# Altium schematic sheet VSR-05-2-2.1.SchDoc
size A4; SheetNumber: 2; SheetTotal: 2
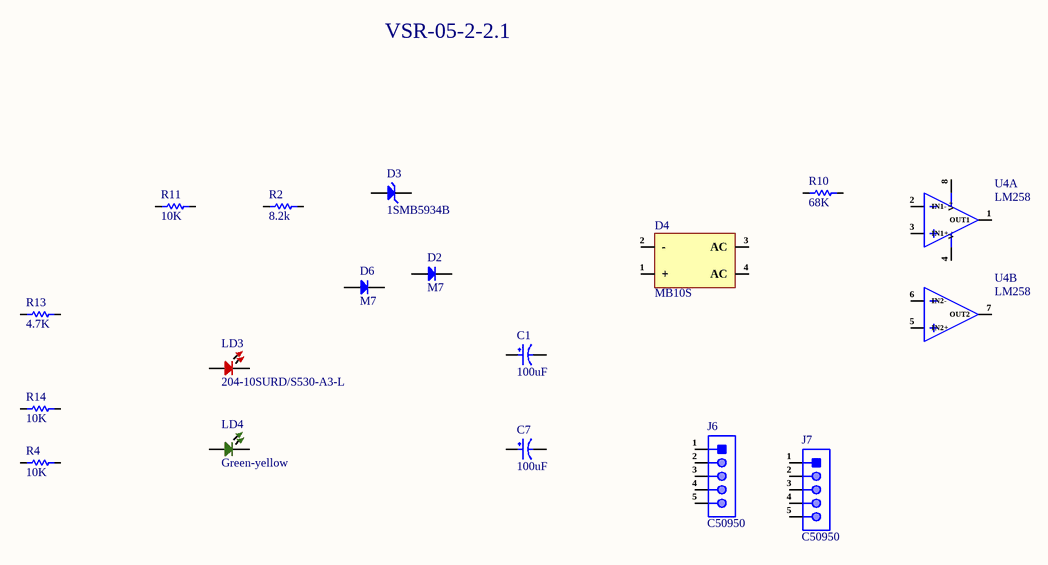
[diagram p0: VSR-05-2-2.1.SchDoc]

## Parts
C1  100uF  [RVT1H101M0607]
C7  100uF  [RVT1H101M0607]
D2  M7  [SMA(DO-214AC)]
D3  1SMB5934B  [SMB_]
D4  MB10S  [MBS10S]
D6  M7  [SMA(DO-214AC)]
J6  C50950  [HDR 1x5 Female]
J7  C50950  [HDR 1x5 Female]
LD3  204-10SURD/S530-A3-L
LD4  Green-yellow  [TH LED Green 3MM]
R2  8.2k  [RES-0805]
R4  10K  [RES-0805]
R10  68K  [RES-0805]
R11  10K  [RES-0805]
R13  4.7K  [RES-0805]
R14  10K  [RES-0805]
U4  LM258  [SOP-8]  (parts A,B of 2)

## Nets

Not connected (* = marked no-connect by the designer): C1 1 2; C7 1 2; D2 1(K) 2(A); D3 1(A) 2(K); D4 1(+) 2(-) 3(AC) 4(AC); D6 1(K) 2(A); J6 1 2 3 4 5; J7 1 2 3 4 5; LD3 1 2; LD4 1 2; R2 1 2; R4 1 2; R10 1 2; R11 1 2; R13 1 2; R14 1 2; U4 1(OUT1) 2(IN1-) 3(IN1+) 4(V-) 5(IN2+) 6(IN2-) 7(OUT2) 8(V+)

## Notes on the sheet
- VSR-05-2-2.1

## Library data of the parts
C1 C7 = RVT1H101M0607: 100uF 50V ±20% SMD,D6.3xL7.7mm Aluminum Electrolytic Capacitors - SMD ROHS; Manufacturer: ROQANG; Manufacturer Part Number: RVT1H101M0607; Package: SMD,D6.3xL7.7mm; LCSC Part Number: C3151829; Item Type: Capacitor; ComponentLink1Description: LCSC; ComponentLink1URL: https://www.lcsc.com/product-detail/Aluminum-Electrolytic-Capacitors-SMD_ROQANG-RVT1H101M0607_C3151829.html
D2 D6 = M7: 1A 1.1V@1A 1kV DO-214AC Diodes - General Purpose ROHS; Manufacturer: MSKSEMI; Item Type: Diode; Manufacturer Part Number: M7; Package: DO-214AC; LCSC Part Number: C2902910; ComponentLink1Description: LCSC; ComponentLink1URL: https://www.lcsc.com/product-detail/Diodes-General-Purpose_MSKSEMI-M7_C2902910.html
D3 = 1SMB5934B: 3W 24V SMB Zener Diodes ROHS; Manufacturer: YFW; Item Type: Diode; Manufacturer Part Number: 1SMB5934B; Package: SMB; LCSC Part Number: C2988044; ComponentLink1Description: LCSC; ComponentLink1URL: https://www.lcsc.com/product-detail/Zener-Diodes_YFW-1SMB5934B_C2988044.html
D4 = MB10S: 35A 1.1V@400mA 1A 1kV MBS Bridge Rectifiers ROHS; Manufacturer: MDD; Manufacturer Part Number: MB10S; Package: MBS; JLCPCB Part Number: C2488; Item Type: Bridge Rectifier; ComponentLink1Description: LCSC; ComponentLink1URL: https://www.lcsc.com/product-detail/Bridge-Rectifiers_MCC_MB6S-TP_MB6S-TP_C85619.html?gclid=CjwKCAjwjOunBhB4EiwA94JWsPhP5VxdRhkKtNAXxaeRo8Kbw1z5VNRY74bvbkYd4a4LtLXYHGrsEhoCPX4QAvD_BwE
J6 J7 = C50950: 2.54mm Plugin Straight 1x5P 5 Plugin,P=2.54mm Female Headers ROHS; Manufacturer: BOOMELE; Manufacturer Part Number: C50950; Package: Plugin,P=2.54mm; LCSC Part Number: C50950; Item Type: Female Header; ComponentLink1Description: LCSC; ComponentLink1URL: https://www.lcsc.com/product-detail/Female-Headers_BOOMELE-Boom-Precision-Elec-C50950_C50950.html
LD3 = 204-10SURD/S530-A3-L: 20mA 624nm -40℃~+85℃ Red 40° 3mm圆形灯头 60mW Plugin,D=3mm Light Emitting Diodes (LED) ROHS; Manufacturer: Everlight Elec; Manufacturer Part Number: 204-10SURD/S530-A3-L; Package: Plugin,D=3mm; LCSC Part Number: C99771; Item Type: LED; ComponentLink1Description: LCSC; ComponentLink1URL: https://www.lcsc.com/product-detail/Light-Emitting-Diodes-LED_Everlight-Elec-204-10SURD-S530-A3-L_C99771.html
LD4 = 204-10SYGD/S530-E3: LED Single Standard Yellow Green 573nm 25mA 2-Pin T-1 Bag; Manufacturer: Everlight; Viewing Angle: 45°; Luminous Intensity: 100mcd; Forward Voltage: 2.4V; Lens Style: Diffused,Colored; Power Dissipation: 60W; Number of Elements: 1; Reverse Voltage: 5V; Supplier: Digikey; Supplier Part Number: 1080-204-10SYGD/S530-E3TR-ND; Manufacturer Part Number: 204-10SYGD/S530-E3; RoHS: Yes; Pricing: 3000=0.10482, 5000=0.09847, 10000=0.09212, 25000=0.08449, 50000=0.08132, 100000=0.07941 (USD); Mounting Technology: Through Hole; Case/Package: T; Pins: 2; Min Operating Temperature: -40°C; Max Operating Temperature: 85°C; Forward Current: 25mA; Packaging: Tape and Reel; Dominant Wavelength: 573nm; Wavelength: 573nm; Length: 4mm; Depth: 4mm; Radiation Hardening: No; RoHS Compliant: Yes; ComponentLink1URL: https://datasheet.ciiva.com/26901/getdatasheetpartid-707371-26901329.pdf?src-supplier=Verical; ComponentLink1Description: https://datasheet.ciiva.com/26901/getdatasheetpartid-707371-26901329.pdf?src-supplier=Verical; LCSC Part Number: C85161; Item Type: LED
R2 = 0805W8F8201T5E: 125mW Thick Film Resistors 150V ±100ppm/℃ ±1% 8.2kΩ 0805 Chip Resistor - Surface Mount ROHS; Manufacturer: Royal Electronic Factory; Value: 8.2kR; Supplier: Mouser; Supplier Part Number: 303-0805W8F8201T5E; Manufacturer Part Number: 0805W8F8201T5E; RoHS: No; Item Type: Resistor; Pricing: 10000=0.002 (USD); LCSC Part Number: C17828
R4 R11 R14 = RC0805FR-7W10KL: RES 10K OHM 1% 1/4W 0805; Manufacturer: Yageo; Item Type: Resistor; Supplier: Avnet; Supplier Part Number: 49AK3472; Manufacturer Part Number: RC0805FR-7W10KL; RoHS: Yes; Category: Chip SMD Resistors; Stock: 5000; Pricing: 1=0.153, 25=0.038, 50=0.03, 100=0.02 (USD); LCSC Part Number: C723404
R10 = 0805W8F6802T5E: 125mW Thick Film Resistors 150V ±100ppm/℃ ±1% 68kΩ 0805 Chip Resistor - Surface Mount ROHS; Manufacturer: Royal Electronic Factory; Value: 68kR; Supplier: Mouser; Supplier Part Number: 303-0805W8F6802T5E; Manufacturer Part Number: 0805W8F6802T5E; RoHS: Yes; Item Type: Resistor; Stock: 85000; Pricing: 10000=0.002 (USD); RoHS Compliant: Yes; LCSC Part Number: C17801
R13 = CRCW08054K70FKEAHP: RES SMD 4.7K OHM 1% 1/2W 0805; Manufacturer: Vishay; Power Rating: 330mW; Voltage Rating: 150V; Resistance: 4.7kR; Temperature Coefficient: 100ppm/°C; Max Power Dissipation: 500mW; Item Type: Resistor; Supplier 1: RSComponents; Manufacturer Part Number: CRCW08054K70FKEAHP; RoHS: Yes; Category: Chip SMD Resistors; Stock 1: 5000; Pricing 1: 25=0.16800, 100=0.15700, 250=0.14600, 500=0.13600, 1000=0.12500 (GBP); Mount: Surface Mount; Case/Package: 0805; Weight: 0.000194oz; Case Code (Imperial): 0805; Case Code (Metric): 2012; Contact Plating: Tin; Min Operating Temperature: -55°C; Max Operating Temperature: 155°C; Tolerance: 1%; Packaging: Tape and Reel; Package Quantity: 5000; Resistor Type: Thick Film; Termination: SMD/SMT; Voltage Rating (DC): 150V; Features: Automotive AEC-Q200; Series: CRCW-HP; Number of Terminations: 2; Resistance Tolerance: 1%; Construction: Rectangular; Technology: THICK FILM; Length: 2mm; Width: 1.2mm; Height: 0.5mm; Depth: 1.25mm; Ratings: AEC-Q200; Radiation Hardening: No; Military Standard: Not; Lead Free: Lead Free; RoHS Compliant: Yes; ComponentLink1URL: https://datasheet.ciiva.com/8079/424479-8079653.pdf?src-supplier=Element14; ComponentLink1Description: https://datasheet.ciiva.com/8079/424479-8079653.pdf?src-supplier=Element14; ComponentLink2URL: https://datasheet.ciiva.com/9072/crcwhpe3-9072073.pdf?src-supplier=Avnet; ComponentLink2Description: https://datasheet.ciiva.com/9072/crcwhpe3-9072073.pdf?src-supplier=Avnet; LCSC Part Number: C313926; Supplier Part Number 1: 8123574
U4 = LM258: Dual 250nA 5mV SOP-8 Operational Amplifier ROHS; Manufacturer: HXY MOSFET; Item Type: Opam; Manufacturer Part Number: LM258; Package: SOP-8; LCSC Part Number: C6851436; ComponentLink1Description: LCSC; ComponentLink1URL: https://www.lcsc.com/product-detail/Operational-Amplifier_HXY-MOSFET-LM258_C6851436.html